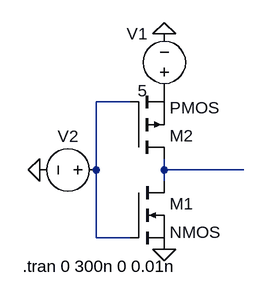
[diagram p0: schematic CMOS Inverter.asc]
CMOS Inverter.asc, the LTspice schematic file:
Version 4.1
SHEET 1 880 680
WIRE 160 80 112 80
WIRE 112 176 112 80
WIRE 208 176 208 160
WIRE 320 176 208 176
WIRE 208 192 208 176
WIRE 112 272 112 176
WIRE 160 272 112 272
FLAG 208 -16 0
FLAG 208 288 0
FLAG 32 176 0
SYMBOL voltage 208 80 R180
WINDOW 0 24 96 Left 2
WINDOW 3 24 16 Left 2
WINDOW 123 0 0 Left 0
WINDOW 39 0 0 Left 0
SYMATTR InstName V1
SYMATTR Value 5
SYMBOL voltage 128 176 R90
WINDOW 0 -32 56 VBottom 2
WINDOW 3 32 56 Invisible 2
WINDOW 123 0 0 Left 0
WINDOW 39 0 0 Left 0
SYMATTR InstName V2
SYMATTR Value PULSE(0 5 100n 1n 1n 10n 100n 2)
SYMBOL nmos 160 192 R0
SYMATTR InstName M1
SYMBOL pmos 160 160 M180
SYMATTR InstName M2
TEXT 8 312 Left 2 !.tran 0 300n 0 0.01n

The netlist it stands for:
* CMOS Inverter.asc
V1 P001 0 5
V2 N001 0 PULSE(0 5 100n 1n 1n 10n 100n 2)
M1 N002 N001 0 0 NMOS
M2 N002 N001 P001 P001 PMOS
.model NMOS NMOS
.model PMOS PMOS
.lib standard.mos
.tran 0 300n 0 0.01n
.backanno
.end